# Altium schematic sheet MonitorSchDoc.SchDoc
size A4; SheetNumber: 2; SheetTotal: 6
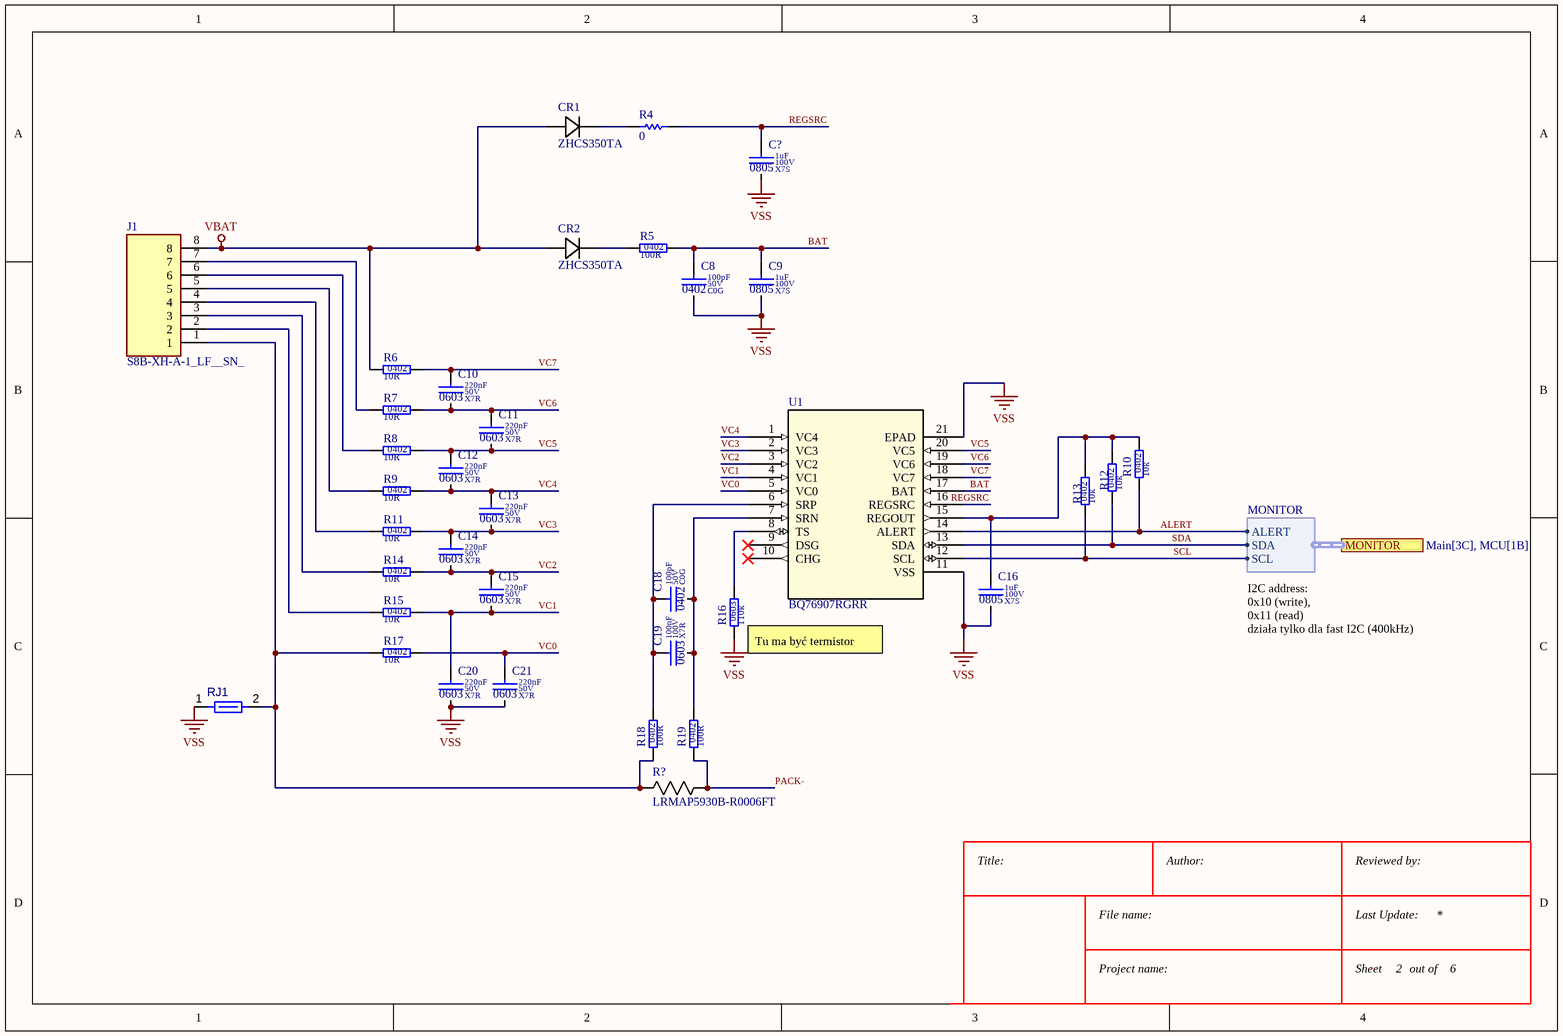
[diagram p0: MonitorSchDoc.SchDoc]

## Parts
C8  value 100pF  Dielectric: C0G  Voltage: 50V  SCH_Footprint: 0402  [C_0402_1005]  (hidden comment: Ceramic C0G)
C9  value 1uF  Dielectric: X7S  Voltage: 100V  SCH_Footprint: 0805  [C_0805_2012]  (hidden comment: Ceramic X7S)
C10  value 220nF  Dielectric: X7R  Voltage: 50V  SCH_Footprint: 0603  [C_0603_1608]  (hidden comment: Ceramic X7R)
C11  value 220nF  Dielectric: X7R  Voltage: 50V  SCH_Footprint: 0603  [C_0603_1608]  (hidden comment: Ceramic X7R)
C12  value 220nF  Dielectric: X7R  Voltage: 50V  SCH_Footprint: 0603  [C_0603_1608]  (hidden comment: Ceramic X7R)
C13  value 220nF  Dielectric: X7R  Voltage: 50V  SCH_Footprint: 0603  [C_0603_1608]  (hidden comment: Ceramic X7R)
C14  value 220nF  Dielectric: X7R  Voltage: 50V  SCH_Footprint: 0603  [C_0603_1608]  (hidden comment: Ceramic X7R)
C15  value 220nF  Dielectric: X7R  Voltage: 50V  SCH_Footprint: 0603  [C_0603_1608]  (hidden comment: Ceramic X7R)
C16  value 1uF  Dielectric: X7S  Voltage: 100V  SCH_Footprint: 0805  [C_0805_2012]  (hidden comment: Ceramic X7S)
C18  value 100pF  Dielectric: C0G  Voltage: 50V  SCH_Footprint: 0402  [C_0402_1005]  (hidden comment: Ceramic C0G)
C19  value 100nF  Dielectric: X7R  Voltage: 100V  SCH_Footprint: 0603  [C_0603_1608]  (hidden comment: Ceramic X7R)
C20  value 220nF  Dielectric: X7R  Voltage: 50V  SCH_Footprint: 0603  [C_0603_1608]  (hidden comment: Ceramic X7R)
C21  value 220nF  Dielectric: X7R  Voltage: 50V  SCH_Footprint: 0603  [C_0603_1608]  (hidden comment: Ceramic X7R)
C?  value 1uF  Dielectric: X7S  Voltage: 100V  SCH_Footprint: 0805  [C_0805_2012]  (hidden comment: Ceramic X7S)
CR1  ZHCS350TA  [CR_350TA_DIO]
CR2  ZHCS350TA  [CR_350TA_DIO]
J1  S8B-XH-A-1_LF__SN_  [S8BXHA1LFSN]
R4  value 0  [RESC1005X40X25ML05T05]  (hidden comment: Resistor 0R +/- 5% 0402 63 mW)
R5  value 100R  SCH_Footprint: 0402  [R_0402_1005]  (hidden comment: Resistor)
R6  value 10R  SCH_Footprint: 0402  [R_0402_1005]  (hidden comment: Resistor)
R7  value 10R  SCH_Footprint: 0402  [R_0402_1005]  (hidden comment: Resistor)
R8  value 10R  SCH_Footprint: 0402  [R_0402_1005]  (hidden comment: Resistor)
R9  value 10R  SCH_Footprint: 0402  [R_0402_1005]  (hidden comment: Resistor)
R10  value 10k  SCH_Footprint: 0402  [R_0402_1005]  (hidden comment: Resistor)
R11  value 10R  SCH_Footprint: 0402  [R_0402_1005]  (hidden comment: Resistor)
R12  value 10k  SCH_Footprint: 0402  [R_0402_1005]  (hidden comment: Resistor)
R13  value 10k  SCH_Footprint: 0402  [R_0402_1005]  (hidden comment: Resistor)
R14  value 10R  SCH_Footprint: 0402  [R_0402_1005]  (hidden comment: Resistor)
R15  value 10R  SCH_Footprint: 0402  [R_0402_1005]  (hidden comment: Resistor)
R16  value 110k  SCH_Footprint: 0603  [R_0603_1608]  (hidden comment: Resistor)
R17  value 10R  SCH_Footprint: 0402  [R_0402_1005]  (hidden comment: Resistor)
R18  value 100R  SCH_Footprint: 0402  [R_0402_1005]  (hidden comment: Resistor)
R19  value 100R  SCH_Footprint: 0402  [R_0402_1005]  (hidden comment: Resistor)
R?  LRMAP5930B-R0006FT  [RES_R0006FT_WEL]
RJ1  Net Tie 12x8mil  [SHORT06-FP]  (value not drawn)  (net tie, no BOM)
U1  BQ76907RGRR  [VQFN20_RGR_TEX]

## Ports
MONITOR (harness MONITOR, see Main[3C], MCU[1B])

## Harnesses
MONITOR: SDA, SCL, ALERT

## Nets
VBAT: CR1.2 CR2.2 J1.8 R6.1
VSS: C8.2 C9.2 C16.2 C20.2 C21.2 C?.2 R16.1 RJ1.1 U1.11(VSS) U1.21(EPAD)
ALERT: R10.1 U1.14(ALERT) ; port MONITOR.ALERT
BAT: C8.1 C9.1 R5.2 U1.17(BAT)
PACK-: R19.1 R?.2
REGSRC: C?.1 R4.2 U1.16(REGSRC)
SCL: R13.1 U1.12(SCL) ; port MONITOR.SCL
SDA: R12.1 U1.13(SDA) ; port MONITOR.SDA
VC0: C21.1 R17.2 U1.5(VC0)
VC1: C15.2 C20.1 R15.2 U1.4(VC1)
VC2: C14.2 C15.1 R14.2 U1.3(VC2)
VC3: C13.2 C14.1 R11.2 U1.2(VC3)
VC4: C12.2 C13.1 R9.2 U1.1(VC4)
VC5: C11.2 C12.1 R8.2 U1.20(VC5)
VC6: C10.2 C11.1 R7.2 U1.19(VC6)
VC7: C10.1 R6.2 U1.18(VC7)
NetC16_1: C16.1 R10.2 R12.2 R13.2 U1.15(REGOUT)
NetC18_1: C18.1 C19.1 R18.2 U1.6(SRP)
NetC18_2: C18.2 C19.2 R19.2 U1.7(SRN)
NetCR1_1: CR1.1 R4.1
NetCR2_1: CR2.1 R5.1
NetJ1_1: J1.1 R17.1 R18.1 R?.1 RJ1.2
NetJ1_2: J1.2 R15.1
NetJ1_3: J1.3 R14.1
NetJ1_4: J1.4 R11.1
NetJ1_5: J1.5 R9.1
NetJ1_6: J1.6 R8.1
NetJ1_7: J1.7 R7.1
NetR16_2: R16.2 U1.8(TS)

Not connected (* = marked no-connect by the designer): U1 9(DSG)* 10(CHG)*

## Notes on the sheet
- (near R16) Tu ma być termistor
- I2C address:
  0x10 (write),
  0x11 (read)
  działa tylko dla fast I2C (400kHz)
- Title:
- File name:
- Author:
- Reviewed by:
- Last Update:
- Project name:
- Sheet
- out of

## Library data of the parts
C8 C18 = C_100pF_50V_C0G_0402_5: Capacitor; Manufacturer: Murata; Manufacturer Part Number: GRM1555C1H101JA01D; Tolerance (%): 5; Part Number: C_100pF_50V_C0G_0402_5; HelpURL: http://www.tme.eu/en/Document/e3e731e59cc68b1ab6d46b158bb05733/MURATA_GRM.pdf; Supplier 1: TME; Supplier Part Number 1: GRM1555C1H101JA01D; Supplier 2: RS Components; Supplier Part Number 2: 7235363; Supplier 3: Farnell; Supplier Part Number 3: 2218836; Supplier 4: Mouser; Supplier Part Number 4: 81-GRM1555C1H101JA1D; Supplier 5: Digi-Key; Supplier Part Number 5: 490-5922-1-ND; Supplier 6: LCSC
C9 C16 C? = C_1uF_100V_X7S_0805_10_AECQ1: Capacitor; Manufacturer: Murata; Manufacturer Part Number: GCM21BC72A105KE36; Tolerance (%): 10; AEC-Q: 1; Part Number: C_1uF_100V_X7S_0805_10_AECQ1; HelpURL: https://www.murata.com/products/productdetail?partno=GCM21BC72A105KE36%23; Supplier 1: TME; Supplier Part Number 1: GCM21BC72A105KE36L; Supplier 2: RS Components; Supplier 3: Farnell; Supplier Part Number 3: 3243166; Supplier 4: Mouser; Supplier Part Number 4: 81-GCM21BC72A105KE6L; Supplier 5: Digi-Key; Supplier Part Number 5: 490-14436-1-ND; Supplier 6: LCSC; Supplier Part Number 6: C126585
C10-C15 C20 C21 = C_220nF_50V_X7R_0603_10_AECQ1: Capacitor; Manufacturer: Murata; Manufacturer Part Number: GCM188R71H224KA64J; Tolerance (%): 10; AEC-Q: 1; Part Number: C_220nF_50V_X7R_0603_10_AECQ1; HelpURL: https://www.murata.com/products/productdetail?partno=GCM188R71H224KA64%23; Supplier 1: TME; Supplier Part Number 1: GCM188R71H224KA64J; Supplier 2: RS Components; Supplier 3: Farnell; Supplier Part Number 3: 3790391; Supplier 4: Mouser; Supplier Part Number 4: 81-GCM188R71H224KA4J; Supplier 5: Digi-Key; Supplier Part Number 5: 490-13307-1-ND; Supplier 6: LCSC; Supplier Part Number 6: C2169489
C19 = C_100nF_100V_X7R_0603_10: Capacitor; Manufacturer: Kemet; Manufacturer Part Number: C0603X104K1RACTU; Tolerance (%): 10; Part Number: C_100nF_100V_X7R_0603_10; HelpURL: https://www.mouser.pl/datasheet/2/447/KEM_C1013_X7R_FT_CAP_SMD-3316633.pdf; Supplier 1: TME; Supplier 2: RS Components; Supplier 3: Farnell; Supplier Part Number 3: 4380077; Supplier 4: Mouser; Supplier Part Number 4: 80-C0603X104K1RACTU; Supplier 5: Digi-Key; Supplier Part Number 5: 399-C0603X104K1RACTUCT-ND; Supplier 6: LCSC
CR1 CR2 = ZHCS350TA: Description; Manufacturer_Name: Diodes Inc; Copyright: Copyright (C) 2026 Ultra Librarian. All rights reserved.; Manufacturer_Part_Number: ZHCS350TA
J1 = S8B-XH-A-1_LF__SN_: Connector; Manufacturer_Name: JST (JAPAN SOLDERLESS TERMINALS); Manufacturer_Part_Number: S8B-XH-A-1(LF)(SN); Datasheet Link: http://www.jst-mfg.com/product/pdf/eng/eXH.pdf; Height: 6.1mm; Mouser Part Number: 306-S8BXHA1LFSN; Mouser Price/Stock: https://www.mouser.co.uk/ProductDetail/JST-Commercial/S8B-XH-A-1LFSN?qs=QpmGXVUTftFKLlmLzIYjBQ%3D%3D; Arrow Part Number: S8B-XH-A-1(LF)(SN); Arrow Price/Stock: https://www.arrow.com/en/products/s8b-xh-a-1-lf-sn/jst-manufacturing?region=europe
R4 = CMP-009-00003-5: Chip Resistor, 0 Ohm, +/- 5%, 63 mW, -55 to 155 degC, 0402 (1005 Metric); Power: 63mW; Voltage Rating: 50V; RoHS Compliant: True; Max Operating Temperature: 155°C; Mounting Technology: SM; Min Operating Temperature: -55°C; Tolerance: 5%; Case/Package: 0402; Pins: 2
R5 R18 R19 = R_100R_0402_1_AECQ0: Manufacturer: Panasonic; Manufacturer Part Number: ERJ-2RKF1000X; Voltage: 50V; Power: 100mW; Tolerance: 1%; AEC-Q: 0; Part Number: R_100R_0402_1_AECQ0; HelpURL: https://industrial.panasonic.com/cdbs/www-data/pdf/RDA0000/AOA0000C304.pdf; Supplier 1: TME; Supplier Part Number 1: ERJ2RKF1000X; Supplier 2: RS Components; Supplier 3: Farnell; Supplier Part Number 3: 2302528; Supplier 4: Mouser; Supplier Part Number 4: 667-ERJ-2RKF1000X; Supplier 5: Digi-Key; Supplier Part Number 5: P100LCT-ND; Supplier 6: LCSC
R6-R9 R11 R14 R15 R17 = R_10R_0402_1: Manufacturer: Yageo; Manufacturer Part Number: RC0402FR-0710R; Voltage: 50V; Power: 63mW; Tolerance: 1%; Part Number: R_10R_0402_1; HelpURL: http://www.tme.eu/pl/Document/1a2bc76e2be68b3b1670068306778ce6/rc0402yageo.pdf; Supplier 1: TME; Supplier Part Number 1: RC0402FR-0710R; Supplier 2: RS Components; Supplier Part Number 2: 6185848; Supplier 3: Farnell; Supplier Part Number 3: 2128710; Supplier 4: Mouser; Supplier Part Number 4: 603-RC0402FR-0710RL; Supplier 5: Digi-Key; Supplier Part Number 5: 311-10.0LRCT-ND; Supplier 6: LCSC
R10 R12 R13 = R_10k_0402_1: Manufacturer: Yageo; Manufacturer Part Number: RC0402FR-0710KL; Voltage: 50V; Power: 63mW; Tolerance: 1%; Part Number: R_10k_0402_1; HelpURL: http://www.tme.eu/pl/Document/1a2bc76e2be68b3b1670068306778ce6/rc0402yageo.pdf; Supplier 1: TME; Supplier Part Number 1: RC0402FR-0710K; Supplier 2: RS Components; Supplier 3: Farnell; Supplier 4: Mouser; Supplier 5: Digi-Key; Supplier 6: LCSC
R16 = R_110k_0603_1: Manufacturer: Royalohm; Manufacturer Part Number: 0603SAF1103T5E; Voltage: 50V; Power: 100mW; Tolerance: 1%; Part Number: R_110k_0603_1; HelpURL: http://www.tme.eu/pl/Document/9e42ba54d36a9bd3dfa2901986ac022d/rezystor-smd.pdf; Supplier 1: TME; Supplier Part Number 1: SMD0603-110K-1%; Supplier 2: RS Components; Supplier 3: Farnell; Supplier Part Number 3: 2845762; Supplier 4: Mouser; Supplier 5: Digi-Key; Supplier 6: LCSC
R? = LRMAP5930B-R0006FT: Description; Manufacturer_Name: TT Electronics; Copyright: Copyright (C) 2025 Ultra Librarian. All rights reserved.; Manufacturer_Part_Number: LRMAP5930B-R0006FT
RJ1 = CMP-009-00121-2: Max Operating Temperature: 155°C; Pins: 2; Min Operating Temperature: -55°C
U1 = BQ76907RGRR: Low-power monitor and protector for 2S to 7S with high accuracy cell voltage measurement 20-VQFN -40 to 110; Manufacturer_Name: Texas Instruments; Type: Power Management; Copyright: Copyright (C) 2026 Ultra Librarian. All rights reserved.; Manufacturer_Part_Number: BQ76907RGRR; RefDes: RefDes